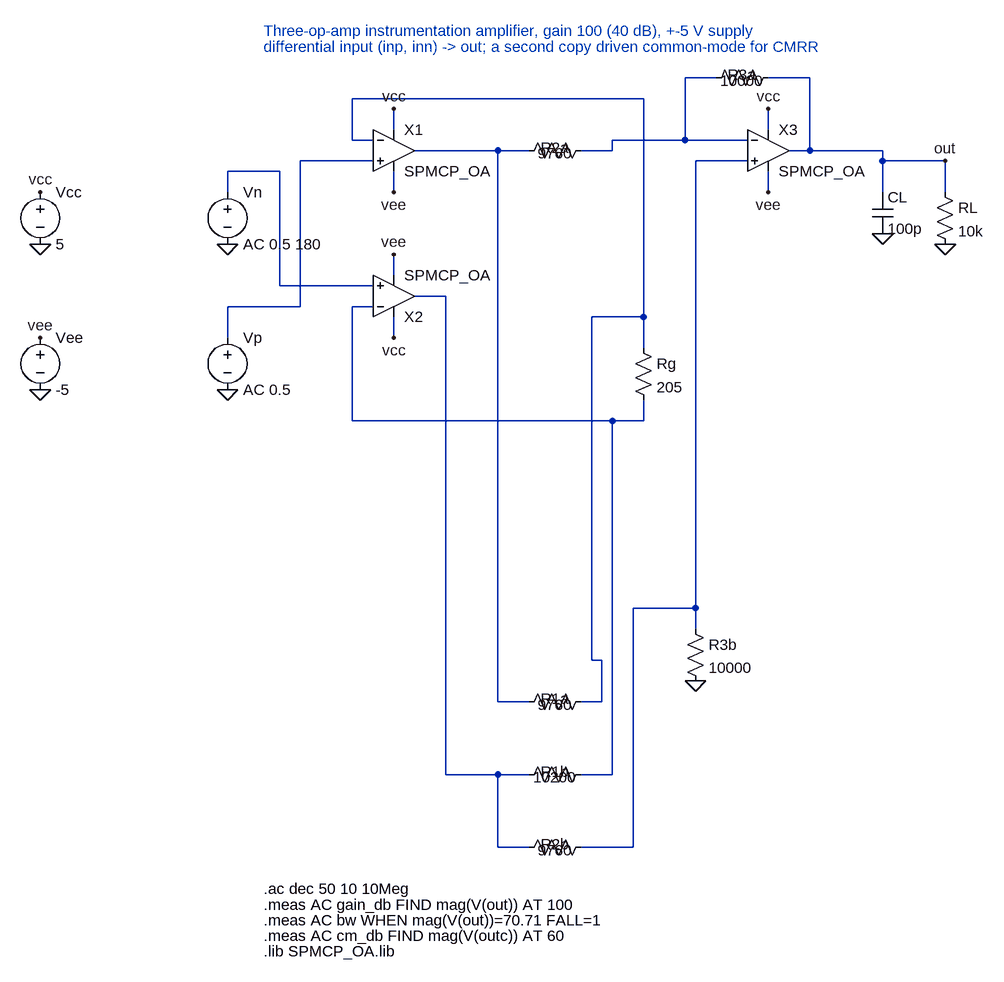
[diagram p0: schematic instrumentation_amp.asc]
instrumentation_amp.asc, the LTspice schematic file:
Version 4.1
SHEET 1 1600 1200
WIRE 736 -16 640 -16
WIRE 640 -16 528 -16
WIRE 528 -16 528 0
WIRE 528 0 480 0
WIRE 688 -112 640 -112
WIRE 640 -112 640 -16
WIRE 160 208 16 208
WIRE 16 208 16 32
WIRE 16 32 -64 32
WIRE -64 32 -64 64
WIRE 800 0 832 0
WIRE 832 0 832 -112
WIRE 832 -112 768 -112
WIRE 944 64 944 16
WIRE 944 16 944 0
WIRE 944 0 832 0
WIRE 1040 64 1040 16
WIRE 1040 16 944 16
WIRE 160 16 48 16
WIRE 48 16 48 240
WIRE 48 240 -64 240
WIRE -64 240 -64 288
WIRE 400 0 352 0
WIRE 352 0 224 0
WIRE 400 848 352 848
WIRE 352 848 352 0
WIRE 400 960 352 960
WIRE 352 960 272 960
WIRE 272 960 272 224
WIRE 272 224 224 224
WIRE 400 1072 352 1072
WIRE 352 1072 352 960
WIRE 576 384 576 416
WIRE 576 416 528 416
WIRE 528 416 128 416
WIRE 128 416 128 240
WIRE 128 240 160 240
WIRE 480 960 528 960
WIRE 528 960 528 416
WIRE 576 304 576 256
WIRE 576 256 576 -80
WIRE 576 -80 128 -80
WIRE 128 -80 128 -16
WIRE 128 -16 160 -16
WIRE 480 848 512 848
WIRE 512 848 512 784
WIRE 512 784 496 784
WIRE 496 784 496 256
WIRE 496 256 576 256
WIRE 656 736 656 704
WIRE 656 704 560 704
WIRE 560 704 560 1072
WIRE 560 1072 480 1072
WIRE 736 16 656 16
WIRE 656 16 656 704
WIRE 192 -32 192 -64
WIRE 192 256 192 288
WIRE 768 -32 768 -64
WIRE 192 32 192 64
WIRE 192 192 192 160
WIRE 768 32 768 64
FLAG 1040 16 out
FLAG -352 64 vcc
FLAG -352 288 vee
FLAG 192 -64 vcc
FLAG 192 64 vee
FLAG 192 288 vcc
FLAG 192 160 vee
FLAG 768 -64 vcc
FLAG 768 64 vee
FLAG -352 144 0
FLAG -352 368 0
FLAG -64 368 0
FLAG -64 144 0
FLAG 656 816 0
FLAG 1040 144 0
FLAG 944 128 0
SYMBOL OpAmps\\opamp2 192 -64 R0
SYMATTR InstName X1
SYMATTR Value SPMCP_OA
SYMBOL OpAmps\\opamp2 192 288 M180
SYMATTR InstName X2
SYMATTR Value SPMCP_OA
SYMBOL OpAmps\\opamp2 768 -64 R0
SYMATTR InstName X3
SYMATTR Value SPMCP_OA
SYMBOL res 384 864 R270
WINDOW 0 36 56 VBottom 2
WINDOW 3 -4 56 VTop 2
SYMATTR InstName R1a
SYMATTR Value 9760
SYMBOL res 384 976 R270
WINDOW 0 36 56 VBottom 2
WINDOW 3 -4 56 VTop 2
SYMATTR InstName R1b
SYMATTR Value 10200
SYMBOL res 384 16 R270
WINDOW 0 36 56 VBottom 2
WINDOW 3 -4 56 VTop 2
SYMATTR InstName R2a
SYMATTR Value 9760
SYMBOL res 384 1088 R270
WINDOW 0 36 56 VBottom 2
WINDOW 3 -4 56 VTop 2
SYMATTR InstName R2b
SYMATTR Value 9760
SYMBOL res 672 -96 R270
WINDOW 0 36 56 VBottom 2
WINDOW 3 -4 56 VTop 2
SYMATTR InstName R3a
SYMATTR Value 10000
SYMBOL res 560 288 R0
SYMATTR InstName Rg
SYMATTR Value 205
SYMBOL cap 928 64 R0
SYMATTR InstName CL
SYMATTR Value 100p
SYMBOL res 640 720 R0
SYMATTR InstName R3b
SYMATTR Value 10000
SYMBOL res 1024 48 R0
SYMATTR InstName RL
SYMATTR Value 10k
SYMBOL voltage -352 48 R0
SYMATTR InstName Vcc
SYMATTR Value 5
SYMBOL voltage -352 272 R0
SYMATTR InstName Vee
SYMATTR Value -5
SYMBOL voltage -64 48 R0
SYMATTR InstName Vn
SYMATTR Value AC 0.5 180
SYMBOL voltage -64 272 R0
SYMATTR InstName Vp
SYMATTR Value AC 0.5
TEXT -8 -184 Left 2 ;Three-op-amp instrumentation amplifier, gain 100 (40 dB), +-5 V supply
TEXT -8 -160 Left 2 ;differential input (inp, inn) -> out; a second copy driven common-mode for CMRR
TEXT -8 1136 Left 2 !.ac dec 50 10 10Meg
TEXT -8 1160 Left 2 !.meas AC gain_db FIND mag(V(out)) AT 100
TEXT -8 1184 Left 2 !.meas AC bw WHEN mag(V(out))=70.71 FALL=1
TEXT -8 1208 Left 2 !.meas AC cm_db FIND mag(V(outc)) AT 60
TEXT -8 1232 Left 2 !.lib SPMCP_OA.lib

The netlist it stands for:
* instrumentation_amp.asc
X§X1 N003 N007 vcc vee N004 SPMCP_OA  ; pins In+ In- V+ V- OUT
X§X2 N002 N006 vcc vee N005 SPMCP_OA  ; pins In+ In- V+ V- OUT
X§X3 N008 N001 vcc vee out SPMCP_OA  ; pins In+ In- V+ V- OUT
R1a N004 N007 9760
R1b N005 N006 10200
R2a N004 N001 9760
R2b N005 N008 9760
R3a N001 out 10000
Rg N007 N006 205
CL out 0 100p
R3b N008 0 10000
RL out 0 10k
Vcc vcc 0 5
Vee vee 0 -5
Vn N002 0 AC 0.5 180
Vp N003 0 AC 0.5
* Three-op-amp instrumentation amplifier, gain 100 (40 dB), +-5 V supply
* differential input (inp, inn) -> out; a second copy driven common-mode for CMRR
.ac dec 50 10 10Meg
.meas AC gain_db FIND mag(V(out)) AT 100
.meas AC bw WHEN mag(V(out))=70.71 FALL=1
.meas AC cm_db FIND mag(V(outc)) AT 60
.lib SPMCP_OA.lib
.backanno
.end